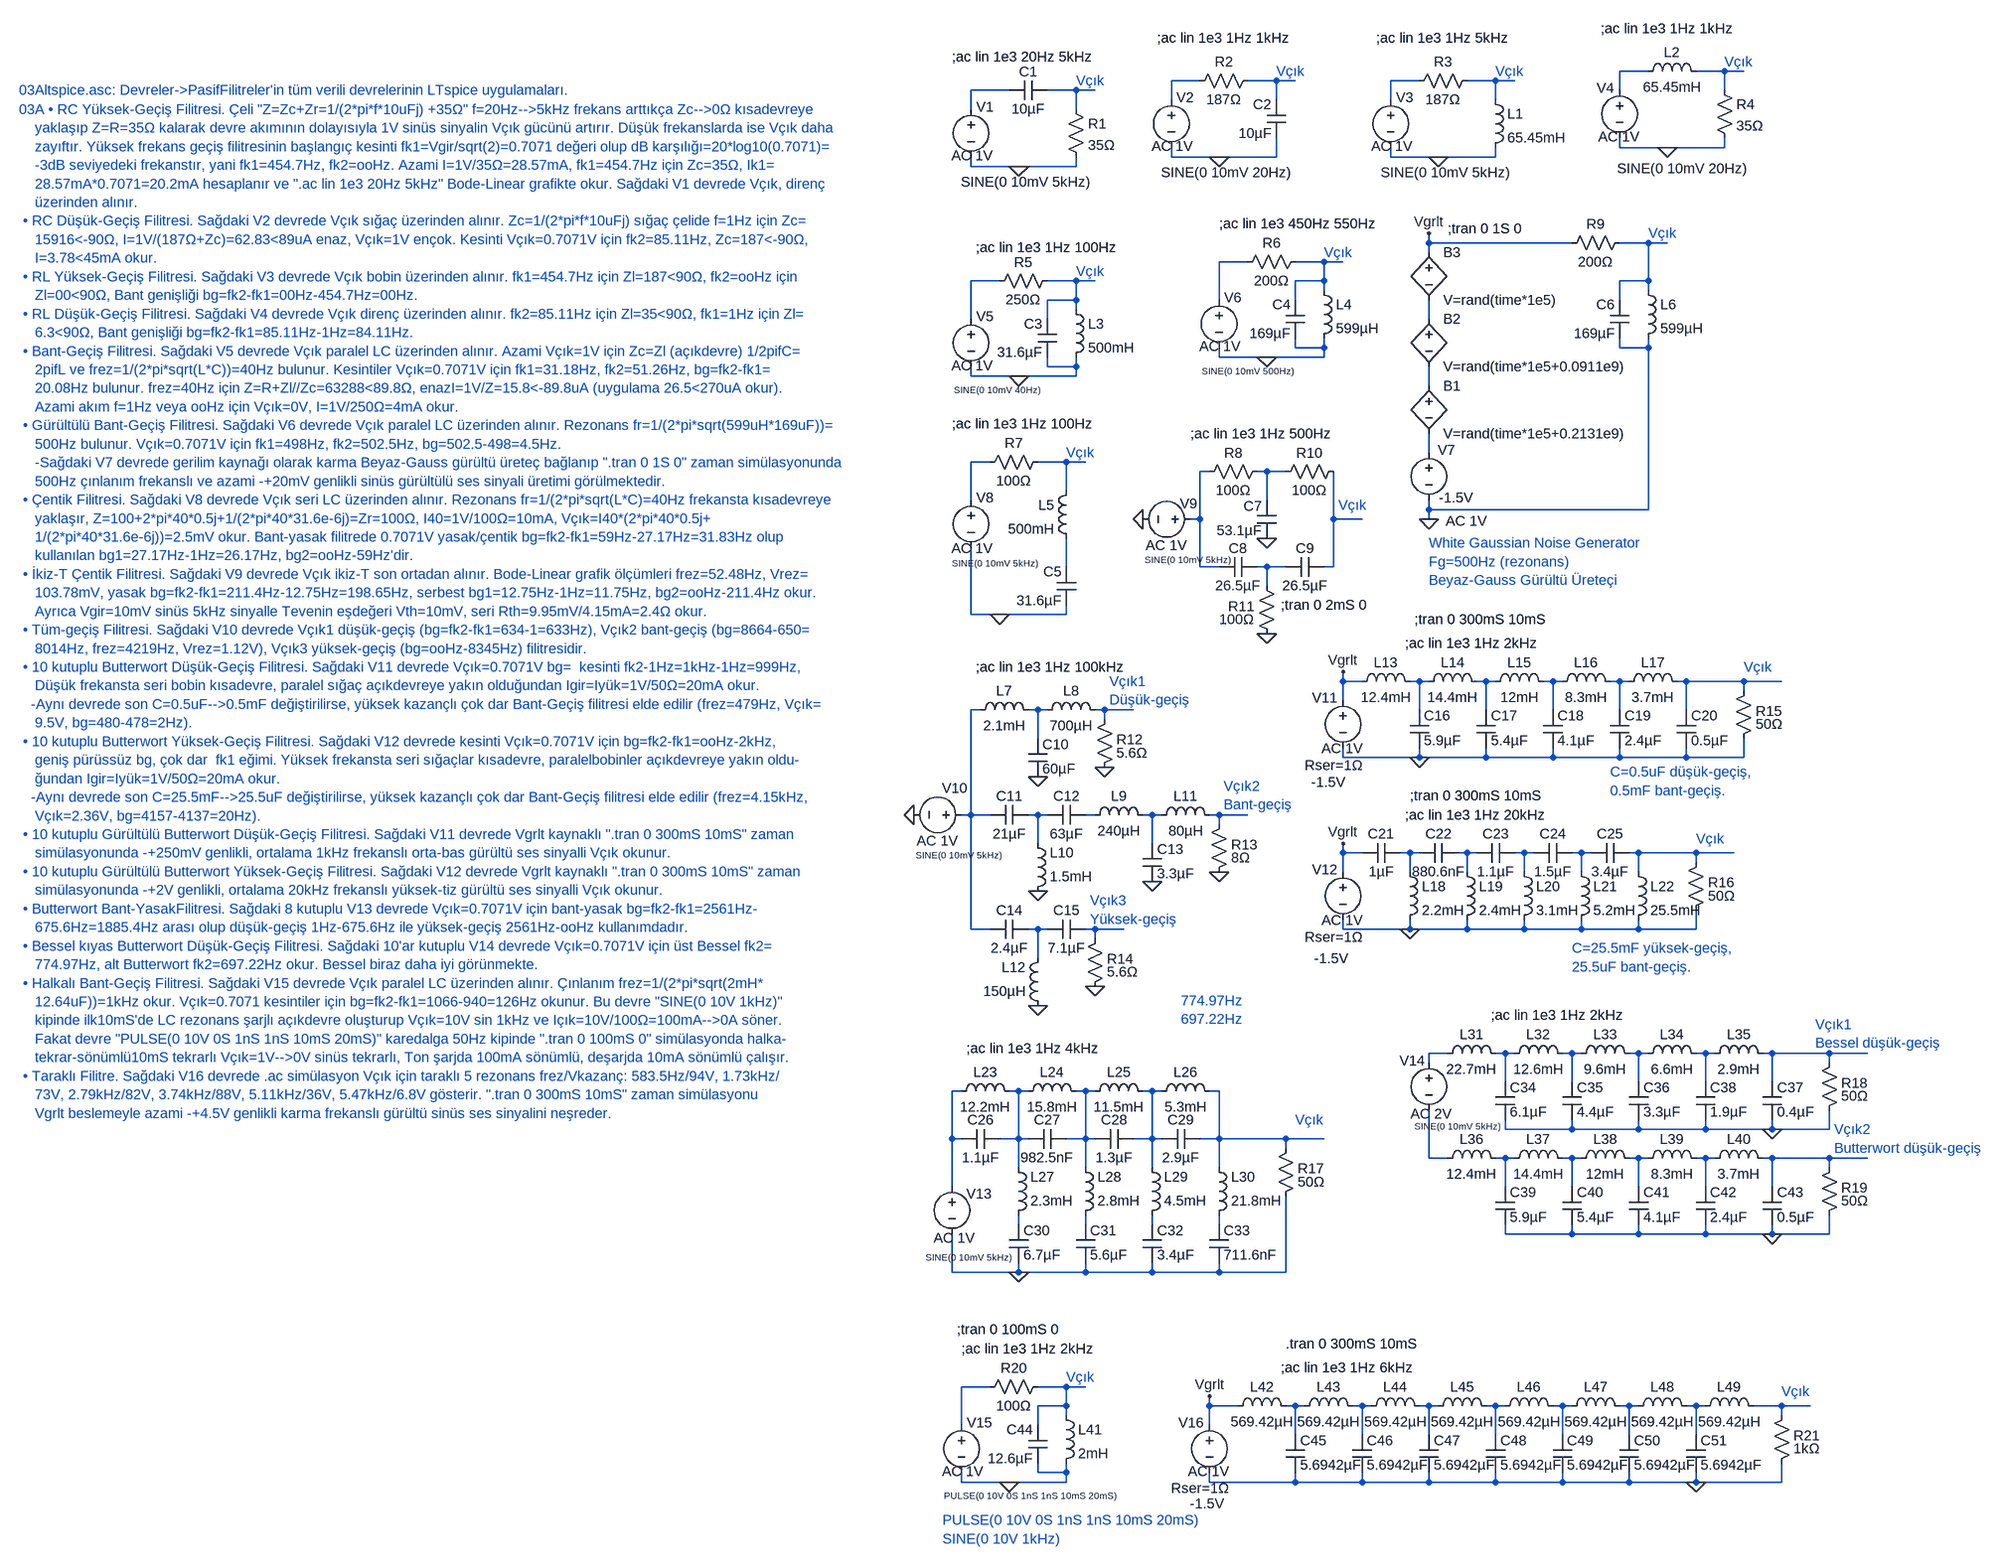
[diagram p0: schematic 03Altspice.asc]
03Altspice.asc, the LTspice schematic file:
Version 4
SHEET 1 3200 2492
WIRE 2224 16 2176 16
WIRE 2352 16 2304 16
WIRE 2384 16 2352 16
WIRE 1472 32 1424 32
WIRE 1600 32 1552 32
WIRE 1632 32 1600 32
WIRE 1840 32 1792 32
WIRE 1968 32 1920 32
WIRE 2000 32 1968 32
WIRE 1152 48 1088 48
WIRE 1264 48 1216 48
WIRE 1296 48 1264 48
WIRE 2176 48 2176 16
WIRE 2352 48 2352 16
WIRE 1424 64 1424 32
WIRE 1600 64 1600 32
WIRE 1792 64 1792 32
WIRE 1968 64 1968 32
WIRE 1088 80 1088 48
WIRE 1264 80 1264 48
WIRE 2176 144 2176 128
WIRE 2256 144 2176 144
WIRE 2352 144 2352 128
WIRE 2352 144 2256 144
WIRE 1424 160 1424 144
WIRE 1504 160 1424 160
WIRE 1600 160 1600 128
WIRE 1600 160 1504 160
WIRE 1792 160 1792 144
WIRE 1872 160 1792 160
WIRE 1968 160 1968 144
WIRE 1968 160 1872 160
WIRE 1088 176 1088 160
WIRE 1168 176 1088 176
WIRE 1264 176 1264 160
WIRE 1264 176 1168 176
WIRE 1856 304 1856 288
WIRE 2096 304 1856 304
WIRE 2224 304 2176 304
WIRE 2256 304 2224 304
WIRE 1856 320 1856 304
WIRE 1552 336 1504 336
WIRE 1680 336 1632 336
WIRE 1712 336 1680 336
WIRE 1136 368 1088 368
WIRE 1264 368 1216 368
WIRE 1296 368 1264 368
WIRE 1680 368 1680 336
WIRE 1680 368 1632 368
WIRE 2224 368 2224 304
WIRE 2224 368 2176 368
WIRE 1680 384 1680 368
WIRE 2224 384 2224 368
WIRE 1264 400 1264 368
WIRE 1264 400 1216 400
WIRE 1504 400 1504 336
WIRE 1632 400 1632 368
WIRE 2176 400 2176 368
WIRE 1264 416 1264 400
WIRE 1088 432 1088 368
WIRE 1216 432 1216 400
WIRE 1856 432 1856 400
WIRE 1632 480 1632 464
WIRE 1680 480 1680 464
WIRE 1680 480 1632 480
WIRE 2176 480 2176 464
WIRE 2224 480 2224 464
WIRE 2224 480 2176 480
WIRE 1504 496 1504 480
WIRE 1584 496 1504 496
WIRE 1680 496 1680 480
WIRE 1680 496 1584 496
WIRE 1216 512 1216 496
WIRE 1264 512 1264 496
WIRE 1264 512 1216 512
WIRE 1088 528 1088 512
WIRE 1168 528 1088 528
WIRE 1264 528 1264 512
WIRE 1264 528 1168 528
WIRE 1856 544 1856 512
WIRE 1856 656 1856 624
WIRE 1120 672 1088 672
WIRE 1248 672 1200 672
WIRE 1280 672 1248 672
WIRE 1488 688 1472 688
WIRE 1584 688 1568 688
WIRE 1616 688 1584 688
WIRE 1248 720 1248 672
WIRE 1088 736 1088 672
WIRE 1584 736 1584 688
WIRE 1856 752 1856 736
WIRE 2224 752 2224 480
WIRE 2224 752 1856 752
WIRE 1472 768 1472 688
WIRE 1472 768 1456 768
WIRE 1696 768 1696 688
WIRE 1744 768 1696 768
WIRE 1856 768 1856 752
WIRE 1248 848 1248 800
WIRE 1472 848 1472 768
WIRE 1504 848 1472 848
WIRE 1584 848 1568 848
WIRE 1616 848 1584 848
WIRE 1696 848 1696 768
WIRE 1696 848 1680 848
WIRE 1584 880 1584 848
WIRE 1088 928 1088 816
WIRE 1136 928 1088 928
WIRE 1248 928 1248 912
WIRE 1248 928 1136 928
WIRE 1712 1040 1712 1024
WIRE 1744 1040 1712 1040
WIRE 1840 1040 1824 1040
WIRE 1856 1040 1840 1040
WIRE 1952 1040 1936 1040
WIRE 1968 1040 1952 1040
WIRE 2064 1040 2048 1040
WIRE 2080 1040 2064 1040
WIRE 2176 1040 2160 1040
WIRE 2192 1040 2176 1040
WIRE 2288 1040 2272 1040
WIRE 2384 1040 2288 1040
WIRE 2448 1040 2384 1040
WIRE 2384 1056 2384 1040
WIRE 1712 1072 1712 1040
WIRE 1104 1088 1088 1088
WIRE 1200 1088 1184 1088
WIRE 1216 1088 1200 1088
WIRE 1312 1088 1296 1088
WIRE 1360 1088 1312 1088
WIRE 1840 1088 1840 1040
WIRE 1952 1088 1952 1040
WIRE 2064 1088 2064 1040
WIRE 2176 1088 2176 1040
WIRE 2288 1088 2288 1040
WIRE 1312 1104 1312 1088
WIRE 1200 1136 1200 1088
WIRE 1712 1168 1712 1152
WIRE 1840 1168 1840 1152
WIRE 1840 1168 1712 1168
WIRE 1952 1168 1952 1152
WIRE 1952 1168 1840 1168
WIRE 2064 1168 2064 1152
WIRE 2064 1168 1952 1168
WIRE 2176 1168 2176 1152
WIRE 2176 1168 2064 1168
WIRE 2288 1168 2288 1152
WIRE 2288 1168 2176 1168
WIRE 2384 1168 2384 1136
WIRE 2384 1168 2288 1168
WIRE 1088 1264 1088 1088
WIRE 1088 1264 1072 1264
WIRE 1120 1264 1088 1264
WIRE 1200 1264 1184 1264
WIRE 1216 1264 1200 1264
WIRE 1296 1264 1280 1264
WIRE 1392 1264 1376 1264
WIRE 1408 1264 1392 1264
WIRE 1504 1264 1488 1264
WIRE 1552 1264 1504 1264
WIRE 1504 1280 1504 1264
WIRE 1200 1312 1200 1264
WIRE 1392 1312 1392 1264
WIRE 1712 1328 1712 1312
WIRE 1744 1328 1712 1328
WIRE 1824 1328 1808 1328
WIRE 1840 1328 1824 1328
WIRE 1920 1328 1904 1328
WIRE 1936 1328 1920 1328
WIRE 2016 1328 2000 1328
WIRE 2032 1328 2016 1328
WIRE 2112 1328 2096 1328
WIRE 2128 1328 2112 1328
WIRE 2208 1328 2192 1328
WIRE 2304 1328 2208 1328
WIRE 2368 1328 2304 1328
WIRE 2304 1344 2304 1328
WIRE 1712 1360 1712 1328
WIRE 1824 1360 1824 1328
WIRE 1920 1360 1920 1328
WIRE 2016 1360 2016 1328
WIRE 2112 1360 2112 1328
WIRE 2208 1360 2208 1328
WIRE 1088 1456 1088 1264
WIRE 1120 1456 1088 1456
WIRE 1200 1456 1184 1456
WIRE 1216 1456 1200 1456
WIRE 1296 1456 1280 1456
WIRE 1344 1456 1296 1456
WIRE 1712 1456 1712 1440
WIRE 1824 1456 1824 1440
WIRE 1824 1456 1712 1456
WIRE 1920 1456 1920 1440
WIRE 1920 1456 1824 1456
WIRE 2016 1456 2016 1440
WIRE 2016 1456 1920 1456
WIRE 2112 1456 2112 1440
WIRE 2112 1456 2016 1456
WIRE 2208 1456 2208 1440
WIRE 2208 1456 2112 1456
WIRE 2304 1456 2304 1424
WIRE 2304 1456 2208 1456
WIRE 1296 1472 1296 1456
WIRE 1200 1504 1200 1456
WIRE 1888 1664 1856 1664
WIRE 1984 1664 1968 1664
WIRE 2000 1664 1984 1664
WIRE 2096 1664 2080 1664
WIRE 2112 1664 2096 1664
WIRE 2208 1664 2192 1664
WIRE 2224 1664 2208 1664
WIRE 2320 1664 2304 1664
WIRE 2336 1664 2320 1664
WIRE 2432 1664 2416 1664
WIRE 2528 1664 2432 1664
WIRE 2592 1664 2528 1664
WIRE 1856 1680 1856 1664
WIRE 2528 1680 2528 1664
WIRE 1984 1712 1984 1664
WIRE 2096 1712 2096 1664
WIRE 2208 1712 2208 1664
WIRE 2320 1712 2320 1664
WIRE 2432 1712 2432 1664
WIRE 1072 1728 1056 1728
WIRE 1168 1728 1152 1728
WIRE 1184 1728 1168 1728
WIRE 1280 1728 1264 1728
WIRE 1296 1728 1280 1728
WIRE 1392 1728 1376 1728
WIRE 1408 1728 1392 1728
WIRE 1504 1728 1488 1728
WIRE 1984 1792 1984 1776
WIRE 2096 1792 2096 1776
WIRE 2096 1792 1984 1792
WIRE 2208 1792 2208 1776
WIRE 2208 1792 2096 1792
WIRE 2320 1792 2320 1776
WIRE 2320 1792 2208 1792
WIRE 2432 1792 2432 1776
WIRE 2432 1792 2320 1792
WIRE 2528 1792 2528 1760
WIRE 2528 1792 2432 1792
WIRE 1056 1808 1056 1728
WIRE 1072 1808 1056 1808
WIRE 1168 1808 1168 1728
WIRE 1168 1808 1136 1808
WIRE 1184 1808 1168 1808
WIRE 1280 1808 1280 1728
WIRE 1280 1808 1248 1808
WIRE 1296 1808 1280 1808
WIRE 1392 1808 1392 1728
WIRE 1392 1808 1360 1808
WIRE 1408 1808 1392 1808
WIRE 1504 1808 1504 1728
WIRE 1504 1808 1472 1808
WIRE 1616 1808 1504 1808
WIRE 1680 1808 1616 1808
WIRE 1616 1824 1616 1808
WIRE 1856 1840 1856 1760
WIRE 1888 1840 1856 1840
WIRE 1984 1840 1968 1840
WIRE 2000 1840 1984 1840
WIRE 2096 1840 2080 1840
WIRE 2112 1840 2096 1840
WIRE 2208 1840 2192 1840
WIRE 2224 1840 2208 1840
WIRE 2320 1840 2304 1840
WIRE 2336 1840 2320 1840
WIRE 2432 1840 2416 1840
WIRE 2528 1840 2432 1840
WIRE 2592 1840 2528 1840
WIRE 1168 1856 1168 1808
WIRE 1280 1856 1280 1808
WIRE 1392 1856 1392 1808
WIRE 1504 1856 1504 1808
WIRE 2528 1856 2528 1840
WIRE 1056 1888 1056 1808
WIRE 1984 1888 1984 1840
WIRE 2096 1888 2096 1840
WIRE 2208 1888 2208 1840
WIRE 2320 1888 2320 1840
WIRE 2432 1888 2432 1840
WIRE 1168 1952 1168 1936
WIRE 1280 1952 1280 1936
WIRE 1392 1952 1392 1936
WIRE 1504 1952 1504 1936
WIRE 1984 1968 1984 1952
WIRE 2096 1968 2096 1952
WIRE 2096 1968 1984 1968
WIRE 2208 1968 2208 1952
WIRE 2208 1968 2096 1968
WIRE 2320 1968 2320 1952
WIRE 2320 1968 2208 1968
WIRE 2432 1968 2432 1952
WIRE 2432 1968 2320 1968
WIRE 2528 1968 2528 1936
WIRE 2528 1968 2432 1968
WIRE 1056 2032 1056 1968
WIRE 1168 2032 1168 2016
WIRE 1168 2032 1056 2032
WIRE 1280 2032 1280 2016
WIRE 1280 2032 1168 2032
WIRE 1392 2032 1392 2016
WIRE 1392 2032 1280 2032
WIRE 1504 2032 1504 2016
WIRE 1504 2032 1392 2032
WIRE 1616 2032 1616 1904
WIRE 1616 2032 1504 2032
WIRE 1120 2224 1072 2224
WIRE 1248 2224 1200 2224
WIRE 1280 2224 1248 2224
WIRE 1248 2256 1248 2224
WIRE 1248 2256 1200 2256
WIRE 1488 2256 1488 2240
WIRE 1536 2256 1488 2256
WIRE 1632 2256 1616 2256
WIRE 1648 2256 1632 2256
WIRE 1744 2256 1728 2256
WIRE 1760 2256 1744 2256
WIRE 1856 2256 1840 2256
WIRE 1872 2256 1856 2256
WIRE 1968 2256 1952 2256
WIRE 1984 2256 1968 2256
WIRE 2080 2256 2064 2256
WIRE 2096 2256 2080 2256
WIRE 2192 2256 2176 2256
WIRE 2208 2256 2192 2256
WIRE 2304 2256 2288 2256
WIRE 2320 2256 2304 2256
WIRE 2448 2256 2400 2256
WIRE 2496 2256 2448 2256
WIRE 1248 2272 1248 2256
WIRE 2448 2272 2448 2256
WIRE 1072 2288 1072 2224
WIRE 1200 2288 1200 2256
WIRE 1488 2288 1488 2256
WIRE 1632 2304 1632 2256
WIRE 1744 2304 1744 2256
WIRE 1856 2304 1856 2256
WIRE 1968 2304 1968 2256
WIRE 2080 2304 2080 2256
WIRE 2192 2304 2192 2256
WIRE 2304 2304 2304 2256
WIRE 1200 2368 1200 2352
WIRE 1248 2368 1248 2352
WIRE 1248 2368 1200 2368
WIRE 1072 2384 1072 2368
WIRE 1152 2384 1072 2384
WIRE 1248 2384 1248 2368
WIRE 1248 2384 1152 2384
WIRE 1488 2384 1488 2368
WIRE 1632 2384 1632 2368
WIRE 1632 2384 1488 2384
WIRE 1744 2384 1744 2368
WIRE 1744 2384 1632 2384
WIRE 1856 2384 1856 2368
WIRE 1856 2384 1744 2384
WIRE 1968 2384 1968 2368
WIRE 1968 2384 1856 2384
WIRE 2080 2384 2080 2368
WIRE 2080 2384 1968 2384
WIRE 2192 2384 2192 2368
WIRE 2192 2384 2080 2384
WIRE 2304 2384 2304 2368
WIRE 2304 2384 2192 2384
WIRE 2448 2384 2448 2352
WIRE 2448 2384 2304 2384
FLAG 1168 176 0
FLAG 1504 160 0
FLAG 1872 160 0
FLAG 2256 144 0
FLAG 1168 528 0
FLAG 1584 496 0
FLAG 1856 768 0
FLAG 1136 928 0
FLAG 1376 768 0
FLAG 1584 800 0
FLAG 1584 960 0
FLAG 1200 1200 0
FLAG 1200 1392 0
FLAG 1392 1376 0
FLAG 1504 1360 0
FLAG 1312 1184 0
FLAG 1200 1584 0
FLAG 1296 1552 0
FLAG 992 1264 0
FLAG 1840 1168 0
FLAG 1824 1456 0
FLAG 1856 288 Vgrlt
FLAG 1712 1024 Vgrlt
FLAG 1712 1312 Vgrlt
FLAG 1168 2032 0
FLAG 2432 1792 0
FLAG 2432 1968 0
FLAG 1152 2384 0
FLAG 2304 2384 0
FLAG 1488 2240 Vgrlt
SYMBOL voltage 1088 64 R0
WINDOW 0 9 12 Left 2
WINDOW 3 -17 138 Left 2
WINDOW 123 -33 94 Left 2
WINDOW 39 0 0 Left 0
SYMATTR InstName V1
SYMATTR Value SINE(0 10mV 5kHz)
SYMATTR Value2 AC 1V
SYMBOL cap 1216 32 R90
WINDOW 0 0 32 VBottom 2
WINDOW 3 32 32 VTop 2
SYMATTR InstName C1
SYMATTR Value 10µF
SYMBOL res 1248 64 R0
SYMATTR InstName R1
SYMATTR Value 35Ω
SYMBOL voltage 1424 48 R0
WINDOW 0 9 12 Left 2
WINDOW 3 -17 138 Left 2
WINDOW 123 -33 94 Left 2
WINDOW 39 0 0 Left 0
SYMATTR InstName V2
SYMATTR Value SINE(0 10mV 20Hz)
SYMATTR Value2 AC 1V
SYMBOL cap 1616 128 R180
WINDOW 0 24 56 Left 2
WINDOW 3 24 8 Left 2
SYMATTR InstName C2
SYMATTR Value 10µF
SYMBOL res 1568 16 R90
WINDOW 0 0 56 VBottom 2
WINDOW 3 32 56 VTop 2
SYMATTR InstName R2
SYMATTR Value 187Ω
SYMBOL voltage 1792 48 R0
WINDOW 0 9 12 Left 2
WINDOW 3 -17 138 Left 2
WINDOW 123 -33 94 Left 2
WINDOW 39 0 0 Left 0
SYMATTR InstName V3
SYMATTR Value SINE(0 10mV 5kHz)
SYMATTR Value2 AC 1V
SYMBOL res 1936 16 R90
WINDOW 0 0 56 VBottom 2
WINDOW 3 32 56 VTop 2
SYMATTR InstName R3
SYMATTR Value 187Ω
SYMBOL ind 1952 48 R0
SYMATTR InstName L1
SYMATTR Value 65.45mH
SYMBOL voltage 2176 32 M0
WINDOW 0 9 12 Left 2
WINDOW 3 -214 147 Left 2
WINDOW 123 -33 94 Left 2
WINDOW 39 0 0 Left 0
SYMATTR InstName V4
SYMATTR Value SINE(0 10mV 20Hz)
SYMATTR Value2 AC 1V
SYMBOL res 2336 32 R0
SYMATTR InstName R4
SYMATTR Value 35Ω
SYMBOL ind 2208 32 R270
WINDOW 0 32 56 VTop 2
WINDOW 3 5 56 VBottom 2
SYMATTR InstName L2
SYMATTR Value 65.45mH
SYMBOL voltage 1088 416 R0
WINDOW 0 9 12 Left 2
WINDOW 3 -29 135 Left 1
WINDOW 123 -33 94 Left 2
WINDOW 39 0 0 Left 0
SYMATTR InstName V5
SYMATTR Value SINE(0 10mV 40Hz)
SYMATTR Value2 AC 1V
SYMBOL res 1232 352 R90
WINDOW 0 0 56 VBottom 2
WINDOW 3 32 56 VTop 2
SYMATTR InstName R5
SYMATTR Value 250Ω
SYMBOL ind 1248 400 R0
SYMATTR InstName L3
SYMATTR Value 500mH
SYMBOL cap 1232 496 R180
WINDOW 0 24 56 Left 2
WINDOW 3 24 8 Left 2
SYMATTR InstName C3
SYMATTR Value 31.6µF
SYMBOL voltage 1504 384 R0
WINDOW 0 9 12 Left 2
WINDOW 3 -29 135 Left 1
WINDOW 123 -33 94 Left 2
WINDOW 39 0 0 Left 0
SYMATTR InstName V6
SYMATTR Value SINE(0 10mV 500Hz)
SYMATTR Value2 AC 1V
SYMBOL res 1648 320 R90
WINDOW 0 0 56 VBottom 2
WINDOW 3 32 56 VTop 2
SYMATTR InstName R6
SYMATTR Value 200Ω
SYMBOL ind 1664 368 R0
SYMATTR InstName L4
SYMATTR Value 599µH
SYMBOL cap 1648 464 R180
WINDOW 0 24 56 Left 2
WINDOW 3 24 8 Left 2
SYMATTR InstName C4
SYMATTR Value 169µF
SYMBOL BV 1856 528 R0
SYMATTR InstName B1
SYMATTR Value V=rand(time*1e5+0.2131e9)
SYMBOL bv 1856 416 R0
SYMATTR InstName B2
SYMATTR Value V=rand(time*1e5+0.0911e9)
SYMBOL bv 1856 304 R0
SYMATTR InstName B3
SYMATTR Value V=rand(time*1e5)
SYMBOL voltage 1856 640 R0
WINDOW 3 17 92 Left 2
WINDOW 123 28 131 Left 2
WINDOW 39 0 0 Left 0
WINDOW 0 15 12 Left 2
SYMATTR Value -1.5V
SYMATTR Value2 AC 1V
SYMATTR InstName V7
SYMBOL res 2192 288 R90
WINDOW 0 0 56 VBottom 2
WINDOW 3 32 56 VTop 2
SYMATTR InstName R9
SYMATTR Value 200Ω
SYMBOL ind 2208 368 R0
SYMATTR InstName L6
SYMATTR Value 599µH
SYMBOL cap 2192 464 R180
WINDOW 0 24 56 Left 2
WINDOW 3 24 8 Left 2
SYMATTR InstName C6
SYMATTR Value 169µF
SYMBOL voltage 1088 720 R0
WINDOW 0 9 12 Left 2
WINDOW 3 -32 122 Left 1
WINDOW 123 -33 97 Left 2
WINDOW 39 0 0 Left 0
SYMATTR InstName V8
SYMATTR Value SINE(0 10mV 5kHz)
SYMATTR Value2 AC 1V
SYMBOL res 1216 656 R90
WINDOW 0 0 56 VBottom 2
WINDOW 3 32 56 VTop 2
SYMATTR InstName R7
SYMATTR Value 100Ω
SYMBOL ind 1264 704 M0
SYMATTR InstName L5
SYMATTR Value 500mH
SYMBOL cap 1264 912 R180
WINDOW 0 24 56 Left 2
WINDOW 3 24 8 Left 2
SYMATTR InstName C5
SYMATTR Value 31.6µF
SYMBOL voltage 1472 768 R90
WINDOW 0 -26 4 VRight 2
WINDOW 3 68 -52 VRight 1
WINDOW 123 44 22 VRight 2
WINDOW 39 0 0 Left 0
SYMATTR InstName V9
SYMATTR Value SINE(0 10mV 5kHz)
SYMATTR Value2 AC 1V
SYMBOL cap 1600 800 R180
WINDOW 0 24 54 Left 2
WINDOW 3 24 13 Left 2
SYMATTR InstName C7
SYMATTR Value 53.1µF
SYMBOL res 1584 672 R90
WINDOW 0 0 56 VBottom 2
WINDOW 3 32 56 VTop 2
SYMATTR InstName R8
SYMATTR Value 100Ω
SYMBOL res 1712 672 R90
WINDOW 0 0 56 VBottom 2
WINDOW 3 32 56 VTop 2
SYMATTR InstName R10
SYMATTR Value 100Ω
SYMBOL cap 1504 864 R270
WINDOW 0 32 32 VTop 2
WINDOW 3 0 32 VBottom 2
SYMATTR InstName C8
SYMATTR Value 26.5µF
SYMBOL cap 1616 864 R270
WINDOW 0 32 32 VTop 2
WINDOW 3 0 32 VBottom 2
SYMATTR InstName C9
SYMATTR Value 26.5µF
SYMBOL res 1600 976 R180
WINDOW 0 36 62 Left 2
WINDOW 3 36 40 Left 2
SYMATTR InstName R11
SYMATTR Value 100Ω
SYMBOL ind 1088 1104 R270
WINDOW 0 32 56 VTop 2
WINDOW 3 5 56 VBottom 2
SYMATTR InstName L7
SYMATTR Value 2.1mH
SYMBOL cap 1184 1200 M180
WINDOW 0 24 54 Left 2
WINDOW 3 24 13 Left 2
SYMATTR InstName C10
SYMATTR Value 60µF
SYMBOL ind 1200 1104 R270
WINDOW 0 32 56 VTop 2
WINDOW 3 5 56 VBottom 2
SYMATTR InstName L8
SYMATTR Value 700µH
SYMBOL res 1296 1200 M180
WINDOW 0 36 62 Left 2
WINDOW 3 36 40 Left 2
SYMATTR InstName R12
SYMATTR Value 5.6Ω
SYMBOL ind 1184 1408 M180
WINDOW 0 36 80 Left 2
WINDOW 3 36 40 Left 2
SYMATTR InstName L10
SYMATTR Value 1.5mH
SYMBOL cap 1120 1280 R270
WINDOW 0 32 32 VTop 2
WINDOW 3 0 32 VBottom 2
SYMATTR InstName C11
SYMATTR Value 21µF
SYMBOL cap 1216 1280 R270
WINDOW 0 32 32 VTop 2
WINDOW 3 0 32 VBottom 2
SYMATTR InstName C12
SYMATTR Value 63µF
SYMBOL ind 1280 1280 R270
WINDOW 0 32 56 VTop 2
WINDOW 3 5 56 VBottom 2
SYMATTR InstName L9
SYMATTR Value 240µH
SYMBOL cap 1376 1376 M180
WINDOW 0 24 54 Left 2
WINDOW 3 24 13 Left 2
SYMATTR InstName C13
SYMATTR Value 3.3µF
SYMBOL ind 1392 1280 R270
WINDOW 0 32 56 VTop 2
WINDOW 3 5 56 VBottom 2
SYMATTR InstName L11
SYMATTR Value 80µH
SYMBOL res 1488 1376 M180
WINDOW 0 36 62 Left 2
WINDOW 3 36 40 Left 2
SYMATTR InstName R13
SYMATTR Value 8Ω
SYMBOL ind 1216 1600 R180
WINDOW 0 36 80 Left 2
WINDOW 3 36 40 Left 2
SYMATTR InstName L12
SYMATTR Value 150µH
SYMBOL cap 1120 1472 R270
WINDOW 0 32 32 VTop 2
WINDOW 3 0 32 VBottom 2
SYMATTR InstName C14
SYMATTR Value 2.4µF
SYMBOL cap 1216 1472 R270
WINDOW 0 32 32 VTop 2
WINDOW 3 0 32 VBottom 2
SYMATTR InstName C15
SYMATTR Value 7.1µF
SYMBOL res 1280 1568 M180
WINDOW 0 36 62 Left 2
WINDOW 3 36 40 Left 2
SYMATTR InstName R14
SYMATTR Value 5.6Ω
SYMBOL voltage 1088 1264 R90
WINDOW 0 -45 6 VRight 2
WINDOW 3 68 -52 VRight 1
WINDOW 123 44 22 VRight 2
WINDOW 39 0 0 Left 0
SYMATTR InstName V10
SYMATTR Value SINE(0 10mV 5kHz)
SYMATTR Value2 AC 1V
SYMBOL ind 1728 1056 R270
WINDOW 0 32 56 VTop 2
WINDOW 3 5 56 VBottom 2
SYMATTR InstName L13
SYMATTR Value 12.4mH
SYMBOL ind 1840 1056 R270
WINDOW 0 32 56 VTop 2
WINDOW 3 5 56 VBottom 2
SYMATTR InstName L14
SYMATTR Value 14.4mH
SYMBOL ind 1952 1056 R270
WINDOW 0 32 56 VTop 2
WINDOW 3 5 56 VBottom 2
SYMATTR InstName L15
SYMATTR Value 12mH
SYMBOL ind 2064 1056 R270
WINDOW 0 32 56 VTop 2
WINDOW 3 5 56 VBottom 2
SYMATTR InstName L16
SYMATTR Value 8.3mH
SYMBOL ind 2176 1056 R270
WINDOW 0 32 56 VTop 2
WINDOW 3 5 56 VBottom 2
SYMATTR InstName L17
SYMATTR Value 3.7mH
SYMBOL cap 1824 1152 M180
WINDOW 0 24 54 Left 2
WINDOW 3 24 13 Left 2
SYMATTR InstName C16
SYMATTR Value 5.9µF
SYMBOL cap 1936 1152 M180
WINDOW 0 24 54 Left 2
WINDOW 3 24 13 Left 2
SYMATTR InstName C17
SYMATTR Value 5.4µF
SYMBOL cap 2048 1152 M180
WINDOW 0 24 54 Left 2
WINDOW 3 24 13 Left 2
SYMATTR InstName C18
SYMATTR Value 4.1µF
SYMBOL cap 2160 1152 M180
WINDOW 0 24 54 Left 2
WINDOW 3 24 13 Left 2
SYMATTR InstName C19
SYMATTR Value 2.4µF
SYMBOL cap 2272 1152 M180
WINDOW 0 24 54 Left 2
WINDOW 3 24 13 Left 2
SYMATTR InstName C20
SYMATTR Value 0.5µF
SYMBOL res 2368 1152 M180
WINDOW 0 36 62 Left 2
WINDOW 3 36 40 Left 2
SYMATTR InstName R15
SYMATTR Value 50Ω
SYMBOL voltage 1712 1056 M0
WINDOW 0 9 12 Left 2
WINDOW 3 -4 153 Left 2
WINDOW 123 -33 97 Left 2
WINDOW 39 -33 125 Left 2
SYMATTR InstName V11
SYMATTR Value -1.5V
SYMATTR Value2 AC 1V
SYMATTR SpiceLine Rser=1Ω
SYMBOL ind 1808 1344 R0
SYMATTR InstName L18
SYMATTR Value 2.2mH
SYMBOL ind 1904 1344 R0
SYMATTR InstName L19
SYMATTR Value 2.4mH
SYMBOL ind 2000 1344 R0
SYMATTR InstName L20
SYMATTR Value 3.1mH
SYMBOL ind 2096 1344 R0
SYMATTR InstName L21
SYMATTR Value 5.2mH
SYMBOL ind 2192 1344 R0
SYMATTR InstName L22
SYMATTR Value 25.5mH
SYMBOL cap 1744 1312 M90
WINDOW 0 0 32 VBottom 2
WINDOW 3 32 32 VTop 2
SYMATTR InstName C21
SYMATTR Value 1µF
SYMBOL cap 1840 1312 M90
WINDOW 0 0 32 VBottom 2
WINDOW 3 32 32 VTop 2
SYMATTR InstName C22
SYMATTR Value 880.6nF
SYMBOL cap 1936 1312 M90
WINDOW 0 0 32 VBottom 2
WINDOW 3 32 32 VTop 2
SYMATTR InstName C23
SYMATTR Value 1.1µF
SYMBOL cap 2032 1312 M90
WINDOW 0 0 32 VBottom 2
WINDOW 3 32 32 VTop 2
SYMATTR InstName C24
SYMATTR Value 1.5µF
SYMBOL cap 2128 1312 M90
WINDOW 0 0 32 VBottom 2
WINDOW 3 32 32 VTop 2
SYMATTR InstName C25
SYMATTR Value 3.4µF
SYMBOL res 2288 1440 M180
WINDOW 0 36 62 Left 2
WINDOW 3 36 40 Left 2
SYMATTR InstName R16
SYMATTR Value 50Ω
SYMBOL voltage 1712 1344 M0
WINDOW 0 9 12 Left 2
WINDOW 3 -9 161 Left 2
WINDOW 123 -33 97 Left 2
WINDOW 39 -33 125 Left 2
SYMATTR InstName V12
SYMATTR Value -1.5V
SYMATTR Value2 AC 1V
SYMATTR SpiceLine Rser=1Ω
SYMBOL ind 1056 1744 R270
WINDOW 0 32 56 VTop 2
WINDOW 3 5 56 VBottom 2
SYMATTR InstName L23
SYMATTR Value 12.2mH
SYMBOL cap 1072 1792 M90
WINDOW 0 0 32 VBottom 2
WINDOW 3 32 32 VTop 2
SYMATTR InstName C26
SYMATTR Value 1.1µF
SYMBOL ind 1168 1744 R270
WINDOW 0 32 56 VTop 2
WINDOW 3 5 56 VBottom 2
SYMATTR InstName L24
SYMATTR Value 15.8mH
SYMBOL cap 1184 1792 M90
WINDOW 0 0 32 VBottom 2
WINDOW 3 32 32 VTop 2
SYMATTR InstName C27
SYMATTR Value 982.5nF
SYMBOL ind 1280 1744 R270
WINDOW 0 32 56 VTop 2
WINDOW 3 5 56 VBottom 2
SYMATTR InstName L25
SYMATTR Value 11.5mH
SYMBOL cap 1296 1792 M90
WINDOW 0 0 32 VBottom 2
WINDOW 3 32 32 VTop 2
SYMATTR InstName C28
SYMATTR Value 1.3µF
SYMBOL ind 1392 1744 R270
WINDOW 0 32 56 VTop 2
WINDOW 3 5 56 VBottom 2
SYMATTR InstName L26
SYMATTR Value 5.3mH
SYMBOL cap 1408 1792 M90
WINDOW 0 0 32 VBottom 2
WINDOW 3 32 32 VTop 2
SYMATTR InstName C29
SYMATTR Value 2.9µF
SYMBOL ind 1152 1952 M180
WINDOW 0 36 80 Left 2
WINDOW 3 36 40 Left 2
SYMATTR InstName L27
SYMATTR Value 2.3mH
SYMBOL ind 1264 1952 M180
WINDOW 0 36 80 Left 2
WINDOW 3 36 40 Left 2
SYMATTR InstName L28
SYMATTR Value 2.8mH
SYMBOL ind 1376 1952 M180
WINDOW 0 36 80 Left 2
WINDOW 3 36 40 Left 2
SYMATTR InstName L29
SYMATTR Value 4.5mH
SYMBOL ind 1488 1952 M180
WINDOW 0 36 80 Left 2
WINDOW 3 36 40 Left 2
SYMATTR InstName L30
SYMATTR Value 21.8mH
SYMBOL cap 1152 2016 M180
WINDOW 0 24 54 Left 2
WINDOW 3 24 13 Left 2
SYMATTR InstName C30
SYMATTR Value 6.7µF
SYMBOL cap 1264 2016 M180
WINDOW 0 24 54 Left 2
WINDOW 3 24 13 Left 2
SYMATTR InstName C31
SYMATTR Value 5.6µF
SYMBOL cap 1376 2016 M180
WINDOW 0 24 54 Left 2
WINDOW 3 24 13 Left 2
SYMATTR InstName C32
SYMATTR Value 3.4µF
SYMBOL cap 1488 2016 M180
WINDOW 0 24 54 Left 2
WINDOW 3 24 13 Left 2
SYMATTR InstName C33
SYMATTR Value 711.6nF
SYMBOL res 1600 1920 M180
WINDOW 0 36 62 Left 2
WINDOW 3 36 40 Left 2
SYMATTR InstName R17
SYMATTR Value 50Ω
SYMBOL voltage 1056 1872 M0
WINDOW 0 -67 28 Left 2
WINDOW 3 -100 135 Left 1
WINDOW 123 -38 102 Left 2
WINDOW 39 0 0 Left 0
SYMATTR InstName V13
SYMATTR Value SINE(0 10mV 5kHz)
SYMATTR Value2 AC 1V
SYMBOL ind 1872 1680 R270
WINDOW 0 32 56 VTop 2
WINDOW 3 5 56 VBottom 2
SYMATTR InstName L31
SYMATTR Value 22.7mH
SYMBOL ind 1984 1680 R270
WINDOW 0 32 56 VTop 2
WINDOW 3 5 56 VBottom 2
SYMATTR InstName L32
SYMATTR Value 12.6mH
SYMBOL ind 2096 1680 R270
WINDOW 0 32 56 VTop 2
WINDOW 3 5 56 VBottom 2
SYMATTR InstName L33
SYMATTR Value 9.6mH
SYMBOL ind 2208 1680 R270
WINDOW 0 32 56 VTop 2
WINDOW 3 5 56 VBottom 2
SYMATTR InstName L34
SYMATTR Value 6.6mH
SYMBOL ind 2320 1680 R270
WINDOW 0 32 56 VTop 2
WINDOW 3 5 56 VBottom 2
SYMATTR InstName L35
SYMATTR Value 2.9mH
SYMBOL cap 1968 1776 M180
WINDOW 0 24 54 Left 2
WINDOW 3 24 13 Left 2
SYMATTR InstName C34
SYMATTR Value 6.1µF
SYMBOL cap 2080 1776 M180
WINDOW 0 24 54 Left 2
WINDOW 3 24 13 Left 2
SYMATTR InstName C35
SYMATTR Value 4.4µF
SYMBOL cap 2192 1776 M180
WINDOW 0 24 54 Left 2
WINDOW 3 24 13 Left 2
SYMATTR InstName C36
SYMATTR Value 3.3µF
SYMBOL cap 2416 1776 M180
WINDOW 0 24 54 Left 2
WINDOW 3 24 13 Left 2
SYMATTR InstName C37
SYMATTR Value 0.4µF
SYMBOL cap 2304 1776 M180
WINDOW 0 24 54 Left 2
WINDOW 3 24 13 Left 2
SYMATTR InstName C38
SYMATTR Value 1.9µF
SYMBOL res 2512 1776 M180
WINDOW 0 36 62 Left 2
WINDOW 3 36 40 Left 2
SYMATTR InstName R18
SYMATTR Value 50Ω
SYMBOL voltage 1856 1664 M0
WINDOW 0 6 13 Left 2
WINDOW 3 -120 123 Left 1
WINDOW 123 -38 102 Left 2
WINDOW 39 0 0 Left 0
SYMATTR InstName V14
SYMATTR Value SINE(0 10mV 5kHz)
SYMATTR Value2 AC 2V
SYMBOL ind 1872 1856 R270
WINDOW 0 32 56 VTop 2
WINDOW 3 5 56 VBottom 2
SYMATTR InstName L36
SYMATTR Value 12.4mH
SYMBOL ind 1984 1856 R270
WINDOW 0 32 56 VTop 2
WINDOW 3 5 56 VBottom 2
SYMATTR InstName L37
SYMATTR Value 14.4mH
SYMBOL ind 2096 1856 R270
WINDOW 0 32 56 VTop 2
WINDOW 3 5 56 VBottom 2
SYMATTR InstName L38
SYMATTR Value 12mH
SYMBOL ind 2208 1856 R270
WINDOW 0 32 56 VTop 2
WINDOW 3 5 56 VBottom 2
SYMATTR InstName L39
SYMATTR Value 8.3mH
SYMBOL ind 2320 1856 R270
WINDOW 0 32 56 VTop 2
WINDOW 3 5 56 VBottom 2
SYMATTR InstName L40
SYMATTR Value 3.7mH
SYMBOL cap 1968 1952 M180
WINDOW 0 24 54 Left 2
WINDOW 3 24 13 Left 2
SYMATTR InstName C39
SYMATTR Value 5.9µF
SYMBOL cap 2080 1952 M180
WINDOW 0 24 54 Left 2
WINDOW 3 24 13 Left 2
SYMATTR InstName C40
SYMATTR Value 5.4µF
SYMBOL cap 2192 1952 M180
WINDOW 0 24 54 Left 2
WINDOW 3 24 13 Left 2
SYMATTR InstName C41
SYMATTR Value 4.1µF
SYMBOL cap 2304 1952 M180
WINDOW 0 24 54 Left 2
WINDOW 3 24 13 Left 2
SYMATTR InstName C42
SYMATTR Value 2.4µF
SYMBOL cap 2416 1952 M180
WINDOW 0 24 54 Left 2
WINDOW 3 24 13 Left 2
SYMATTR InstName C43
SYMATTR Value 0.5µF
SYMBOL res 2512 1952 M180
WINDOW 0 36 62 Left 2
WINDOW 3 36 40 Left 2
SYMATTR InstName R19
SYMATTR Value 50Ω
SYMBOL voltage 1072 2272 R0
WINDOW 0 9 12 Left 2
WINDOW 3 -29 135 Left 1
WINDOW 123 -33 94 Left 2
WINDOW 39 0 0 Left 0
SYMATTR InstName V15
SYMATTR Value PULSE(0 10V 0S 1nS 1nS 10mS 20mS)
SYMATTR Value2 AC 1V
SYMBOL res 1216 2208 R90
WINDOW 0 0 56 VBottom 2
WINDOW 3 32 56 VTop 2
SYMATTR InstName R20
SYMATTR Value 100Ω
SYMBOL ind 1232 2256 R0
SYMATTR InstName L41
SYMATTR Value 2mH
SYMBOL cap 1216 2352 R180
WINDOW 0 24 56 Left 2
WINDOW 3 24 8 Left 2
SYMATTR InstName C44
SYMATTR Value 12.6µF
SYMBOL ind 1520 2272 R270
WINDOW 0 32 56 VTop 2
WINDOW 3 5 56 VBottom 2
SYMATTR InstName L42
SYMATTR Value 569.42µH
SYMBOL ind 1632 2272 R270
WINDOW 0 32 56 VTop 2
WINDOW 3 5 56 VBottom 2
SYMATTR InstName L43
SYMATTR Value 569.42µH
SYMBOL ind 1744 2272 R270
WINDOW 0 32 56 VTop 2
WINDOW 3 5 56 VBottom 2
SYMATTR InstName L44
SYMATTR Value 569.42µH
SYMBOL ind 1856 2272 R270
WINDOW 0 32 56 VTop 2
WINDOW 3 5 56 VBottom 2
SYMATTR InstName L45
SYMATTR Value 569.42µH
SYMBOL ind 1968 2272 R270
WINDOW 0 32 56 VTop 2
WINDOW 3 5 56 VBottom 2
SYMATTR InstName L46
SYMATTR Value 569.42µH
SYMBOL ind 2080 2272 R270
WINDOW 0 32 56 VTop 2
WINDOW 3 5 56 VBottom 2
SYMATTR InstName L47
SYMATTR Value 569.42µH
SYMBOL ind 2192 2272 R270
WINDOW 0 32 56 VTop 2
WINDOW 3 5 56 VBottom 2
SYMATTR InstName L48
SYMATTR Value 569.42µH
SYMBOL ind 2304 2272 R270
WINDOW 0 32 56 VTop 2
WINDOW 3 5 56 VBottom 2
SYMATTR InstName L49
SYMATTR Value 569.42µH
SYMBOL cap 1616 2368 M180
WINDOW 0 24 54 Left 2
WINDOW 3 24 13 Left 2
SYMATTR InstName C45
SYMATTR Value 5.6942µF
SYMBOL cap 1728 2368 M180
WINDOW 0 24 54 Left 2
WINDOW 3 24 13 Left 2
SYMATTR InstName C46
SYMATTR Value 5.6942µF
SYMBOL cap 1840 2368 M180
WINDOW 0 24 54 Left 2
WINDOW 3 24 13 Left 2
SYMATTR InstName C47
SYMATTR Value 5.6942µF
SYMBOL cap 1952 2368 M180
WINDOW 0 24 54 Left 2
WINDOW 3 24 13 Left 2
SYMATTR InstName C48
SYMATTR Value 5.6942µF
SYMBOL cap 2064 2368 M180
WINDOW 0 24 54 Left 2
WINDOW 3 24 13 Left 2
SYMATTR InstName C49
SYMATTR Value 5.6942µF
SYMBOL cap 2176 2368 M180
WINDOW 0 24 54 Left 2
WINDOW 3 24 13 Left 2
SYMATTR InstName C50
SYMATTR Value 5.6942µF
SYMBOL cap 2288 2368 M180
WINDOW 0 24 54 Left 2
WINDOW 3 24 13 Left 2
SYMATTR InstName C51
SYMATTR Value 5.6942µF
SYMBOL res 2432 2368 M180
WINDOW 0 36 62 Left 2
WINDOW 3 36 40 Left 2
SYMATTR InstName R21
SYMATTR Value 1kΩ
SYMBOL voltage 1488 2272 M0
WINDOW 0 9 12 Left 2
WINDOW 3 -25 148 Left 2
WINDOW 123 -33 94 Left 2
WINDOW 39 -33 122 Left 2
SYMATTR InstName V16
SYMATTR Value -1.5V
SYMATTR Value2 AC 1V
SYMATTR SpiceLine Rser=1Ω
TEXT -784 48 Left 2 ;03Altspice.asc: Devreler->PasifFilitreler'in tüm verili devrelerinin LTspice uygulamaları.
TEXT -784 80 Left 2 ;03A • RC Yüksek-Geçiş Filitresi. Çeli "Z=Zc+Zr=1/(2*pi*f*10uFj) +35Ω" f=20Hz-->5kHz frekans arttıkça Zc-->0Ω kısadevreye\n    yaklaşıp Z=R=35Ω kalarak devre akımının dolayısıyla 1V sinüs sinyalin Vçık gücünü artırır. Düşük frekanslarda ise Vçık daha\n    zayıftır. Yüksek frekans geçiş filitresinin başlangıç kesinti fk1=Vgir/sqrt(2)=0.7071 değeri olup dB karşılığı=20*log10(0.7071)=\n    -3dB seviyedeki frekanstır, yani fk1=454.7Hz, fk2=ooHz. Azami I=1V/35Ω=28.57mA, fk1=454.7Hz için Zc=35Ω, Ik1=\n    28.57mA*0.7071=20.2mA hesaplanır ve ".ac lin 1e3 20Hz 5kHz" Bode-Linear grafikte okur. Sağdaki V1 devrede Vçık, direnç\n    üzerinden alınır.\n • RC Düşük-Geçiş Filitresi. Sağdaki V2 devrede Vçık sığaç üzerinden alınır. Zc=1/(2*pi*f*10uFj) sığaç çelide f=1Hz için Zc=\n    15916<-90Ω, I=1V/(187Ω+Zc)=62.83<89uA enaz, Vçık=1V ençok. Kesinti Vçık=0.7071V için fk2=85.11Hz, Zc=187<-90Ω,\n    I=3.78<45mA okur.\n • RL Yüksek-Geçiş Filitresi. Sağdaki V3 devrede Vçık bobin üzerinden alınır. fk1=454.7Hz için Zl=187<90Ω, fk2=ooHz için \n    Zl=00<90Ω, Bant genişliği bg=fk2-fk1=00Hz-454.7Hz=00Hz.\n • RL Düşük-Geçiş Filitresi. Sağdaki V4 devrede Vçık direnç üzerinden alınır. fk2=85.11Hz için Zl=35<90Ω, fk1=1Hz için Zl=\n    6.3<90Ω, Bant genişliği bg=fk2-fk1=85.11Hz-1Hz=84.11Hz.\n • Bant-Geçiş Filitresi. Sağdaki V5 devrede Vçık paralel LC üzerinden alınır. Azami Vçık=1V için Zc=Zl (açıkdevre) 1/2pifC=\n    2pifL ve frez=1/(2*pi*sqrt(L*C))=40Hz bulunur. Kesintiler Vçık=0.7071V için fk1=31.18Hz, fk2=51.26Hz, bg=fk2-fk1=\n    20.08Hz bulunur. frez=40Hz için Z=R+Zl//Zc=63288<89.8Ω, enazI=1V/Z=15.8<-89.8uA (uygulama 26.5<270uA okur).\n    Azami akım f=1Hz veya ooHz için Vçık=0V, I=1V/250Ω=4mA okur.\n • Gürültülü Bant-Geçiş Filitresi. Sağdaki V6 devrede Vçık paralel LC üzerinden alınır. Rezonans fr=1/(2*pi*sqrt(599uH*169uF))=\n    500Hz bulunur. Vçık=0.7071V için fk1=498Hz, fk2=502.5Hz, bg=502.5-498=4.5Hz.\n    -Sağdaki V7 devrede gerilim kaynağı olarak karma Beyaz-Gauss gürültü üreteç bağlanıp ".tran 0 1S 0" zaman simülasyonunda \n    500Hz çınlanım frekanslı ve azami -+20mV genlikli sinüs gürültülü ses sinyali üretimi görülmektedir.\n • Çentik Filitresi. Sağdaki V8 devrede Vçık seri LC üzerinden alınır. Rezonans fr=1/(2*pi*sqrt(L*C)=40Hz frekansta kısadevreye\n    yaklaşır, Z=100+2*pi*40*0.5j+1/(2*pi*40*31.6e-6j)=Zr=100Ω, I40=1V/100Ω=10mA, Vçık=I40*(2*pi*40*0.5j+\n    1/(2*pi*40*31.6e-6j))=2.5mV okur. Bant-yasak filitrede 0.7071V yasak/çentik bg=fk2-fk1=59Hz-27.17Hz=31.83Hz olup\n    kullanılan bg1=27.17Hz-1Hz=26.17Hz, bg2=ooHz-59Hz'dir.\n • İkiz-T Çentik Filitresi. Sağdaki V9 devrede Vçık ikiz-T son ortadan alınır. Bode-Linear grafik ölçümleri frez=52.48Hz, Vrez=\n    103.78mV, yasak bg=fk2-fk1=211.4Hz-12.75Hz=198.65Hz, serbest bg1=12.75Hz-1Hz=11.75Hz, bg2=ooHz-211.4Hz okur.\n    Ayrıca Vgir=10mV sinüs 5kHz sinyalle Tevenin eşdeğeri Vth=10mV, seri Rth=9.95mV/4.15mA=2.4Ω okur.\n • Tüm-geçiş Filitresi. Sağdaki V10 devrede Vçık1 düşük-geçiş (bg=fk2-fk1=634-1=633Hz), Vçık2 bant-geçiş (bg=8664-650=\n    8014Hz, frez=4219Hz, Vrez=1.12V), Vçık3 yüksek-geçiş (bg=ooHz-8345Hz) filitresidir.\n • 10 kutuplu Butterwort Düşük-Geçiş Filitresi. Sağdaki V11 devrede Vçık=0.7071V bg=  kesinti fk2-1Hz=1kHz-1Hz=999Hz,\n    Düşük frekansta seri bobin kısadevre, paralel sığaç açıkdevreye yakın olduğundan Igir=Iyük=1V/50Ω=20mA okur.\n   -Aynı devrede son C=0.5uF-->0.5mF değiştirilirse, yüksek kazançlı çok dar Bant-Geçiş filitresi elde edilir (frez=479Hz, Vçık=\n    9.5V, bg=480-478=2Hz).\n • 10 kutuplu Butterwort Yüksek-Geçiş Filitresi. Sağdaki V12 devrede kesinti Vçık=0.7071V için bg=fk2-fk1=ooHz-2kHz,\n    geniş pürüssüz bg, çok dar  fk1 eğimi. Yüksek frekansta seri sığaçlar kısadevre, paralelbobinler açıkdevreye yakın oldu-\n    ğundan Igir=Iyük=1V/50Ω=20mA okur.\n   -Aynı devrede son C=25.5mF-->25.5uF değiştirilirse, yüksek kazançlı çok dar Bant-Geçiş filitresi elde edilir (frez=4.15kHz, \n    Vçık=2.36V, bg=4157-4137=20Hz).\n • 10 kutuplu Gürültülü Butterwort Düşük-Geçiş Filitresi. Sağdaki V11 devrede Vgrlt kaynaklı ".tran 0 300mS 10mS" zaman\n    simülasyonunda -+250mV genlikli, ortalama 1kHz frekanslı orta-bas gürültü ses sinyalli Vçık okunur.\n • 10 kutuplu Gürültülü Butterwort Yüksek-Geçiş Filitresi. Sağdaki V12 devrede Vgrlt kaynaklı ".tran 0 300mS 10mS" zaman\n    simülasyonunda -+2V genlikli, ortalama 20kHz frekanslı yüksek-tiz gürültü ses sinyalli Vçık okunur.\n • Butterwort Bant-YasakFilitresi. Sağdaki 8 kutuplu V13 devrede Vçık=0.7071V için bant-yasak bg=fk2-fk1=2561Hz-\n    675.6Hz=1885.4Hz arası olup düşük-geçiş 1Hz-675.6Hz ile yüksek-geçiş 2561Hz-ooHz kullanımdadır.\n • Bessel kıyas Butterwort Düşük-Geçiş Filitresi. Sağdaki 10'ar kutuplu V14 devrede Vçık=0.7071V için üst Bessel fk2=\n    774.97Hz, alt Butterwort fk2=697.22Hz okur. Bessel biraz daha iyi görünmekte.\n • Halkalı Bant-Geçiş Filitresi. Sağdaki V15 devrede Vçık paralel LC üzerinden alınır. Çınlanım frez=1/(2*pi*sqrt(2mH*\n    12.64uF))=1kHz okur. Vçık=0.7071 kesintiler için bg=fk2-fk1=1066-940=126Hz okunur. Bu devre "SINE(0 10V 1kHz)" \n    kipinde ilk10mS'de LC rezonans şarjlı açıkdevre oluşturup Vçık=10V sin 1kHz ve Içık=10V/100Ω=100mA-->0A söner. \n    Fakat devre "PULSE(0 10V 0S 1nS 1nS 10mS 20mS)" karedalga 50Hz kipinde ".tran 0 100mS 0" simülasyonda halka-\n    tekrar-sönümlü10mS tekrarlı Vçık=1V-->0V sinüs tekrarlı, Ton şarjda 100mA sönümlü, deşarjda 10mA sönümlü çalışır.\n • Taraklı Filitre. Sağdaki V16 devrede .ac simülasyon Vçık için taraklı 5 rezonans frez/Vkazanç: 583.5Hz/94V, 1.73kHz/\n    73V, 2.79kHz/82V, 3.74kHz/88V, 5.11kHz/36V, 5.47kHz/6.8V gösterir. ".tran 0 300mS 10mS" zaman simülasyonu\n    Vgrlt beslemeyle azami -+4.5V genlikli karma frekanslı gürültü sinüs ses sinyalini neşreder.
TEXT 1056 -8 Left 2 !;ac lin 1e3 20Hz 5kHz
TEXT 1264 32 Left 2 ;Vçık
TEXT 1600 16 Left 2 ;Vçık
TEXT 1400 -40 Left 2 !;ac lin 1e3 1Hz 1kHz
TEXT 1968 16 Left 2 ;Vçık
TEXT 1768 -40 Left 2 !;ac lin 1e3 1Hz 5kHz
TEXT 2352 0 Left 2 ;Vçık
TEXT 2144 -56 Left 2 !;ac lin 1e3 1Hz 1kHz
TEXT 1264 352 Left 2 ;Vçık
TEXT 1096 312 Left 2 !;ac lin 1e3 1Hz 100Hz
TEXT 1680 320 Left 2 ;Vçık
TEXT 1504 272 Left 2 !;ac lin 1e3 450Hz 550Hz
TEXT 1888 280 Left 2 !;tran 0 1S 0
TEXT 1856 808 Left 2 ;White Gaussian Noise Generator\nFg=500Hz (rezonans)\nBeyaz-Gauss Gürültü Üreteçi
TEXT 2224 288 Left 2 ;Vçık
TEXT 1248 656 Left 2 ;Vçık
TEXT 1056 608 Left 2 !;ac lin 1e3 1Hz 100Hz
TEXT 1704 744 Left 2 ;Vçık
TEXT 1456 624 Left 2 !;ac lin 1e3 1Hz 500Hz
TEXT 1608 912 Left 2 !;tran 0 2mS 0
TEXT 1096 1016 Left 2 !;ac lin 1e3 1Hz 100kHz
TEXT 1320 1040 Left 2 ;Vçık1\nDüşük-geçiş
TEXT 1512 1216 Left 2 ;Vçık2\nBant-geçiş
TEXT 1288 1408 Left 2 ;Vçık3\nYüksek-geçiş
TEXT 2384 1016 Left 2 ;Vçık
TEXT 1816 976 Left 2 !;ac lin 1e3 1Hz 2kHz
TEXT 2304 1304 Left 2 ;Vçık
TEXT 1816 1264 Left 2 !;ac lin 1e3 1Hz 20kHz
TEXT 2160 1192 Left 2 ;C=0.5uF düşük-geçiş,\n0.5mF bant-geçiş.
TEXT 2096 1488 Left 2 ;C=25.5mF yüksek-geçiş,\n25.5uF bant-geçiş.
TEXT 1832 936 Left 2 !;tran 0 300mS 10mS
TEXT 1824 1232 Left 2 !;tran 0 300mS 10mS
TEXT 1632 1776 Left 2 ;Vçık
TEXT 1080 1656 Left 2 !;ac lin 1e3 1Hz 4kHz
TEXT 2504 1616 Left 2 ;Vçık1\nBessel düşük-geçiş
TEXT 1960 1600 Left 2 !;ac lin 1e3 1Hz 2kHz
TEXT 2536 1792 Left 2 ;Vçık2\nButterwort düşük-geçiş
TEXT 1440 1576 Left 2 ;774.97Hz\n697.22Hz
TEXT 1248 2208 Left 2 ;Vçık
TEXT 1072 2160 Left 2 !;ac lin 1e3 1Hz 2kHz
TEXT 1064 2128 Left 2 !;tran 0 100mS 0
TEXT 1040 2448 Left 2 ;PULSE(0 10V 0S 1nS 1nS 10mS 20mS)\nSINE(0 10V 1kHz)
TEXT 1608 2192 Left 2 !;ac lin 1e3 1Hz 6kHz
TEXT 2448 2232 Left 2 ;Vçık
TEXT 1616 2152 Left 2 !.tran 0 300mS 10mS

The netlist it stands for:
* 03Altspice.asc
V1 N007 0 SINE(0 10mV 5kHz) AC 1V
C1 N008 N007 10µF
R1 N008 0 35Ω
V2 N003 0 SINE(0 10mV 20Hz) AC 1V
C2 0 N004 10µF
R2 N004 N003 187Ω
V3 N005 0 SINE(0 10mV 5kHz) AC 1V
R3 N006 N005 187Ω
L1 N006 0 65.45mH
V4 N001 0 SINE(0 10mV 20Hz) AC 1V
R4 N002 0 35Ω
L2 N001 N002 65.45mH
V5 N012 0 SINE(0 10mV 40Hz) AC 1V
R5 N013 N012 250Ω
L3 N013 0 500mH
C3 0 N013 31.6µF
V6 N010 0 SINE(0 10mV 500Hz) AC 1V
R6 N011 N010 200Ω
L4 N011 0 599µH
C4 0 N011 169µF
B1 N015 N016 V=rand(time*1e5+0.2131e9)
B2 N014 N015 V=rand(time*1e5+0.0911e9)
B3 Vgrlt N014 V=rand(time*1e5)
V7 N016 0 -1.5V AC 1V
R9 N009 Vgrlt 200Ω
L6 N009 0 599µH
C6 0 N009 169µF
V8 N017 0 SINE(0 10mV 5kHz) AC 1V
R7 N018 N017 100Ω
L5 N018 N022 500mH
C5 0 N022 31.6µF
V9 N019 0 SINE(0 10mV 5kHz) AC 1V
C7 0 N020 53.1µF
R8 N020 N019 100Ω
R10 N021 N020 100Ω
C8 N019 N023 26.5µF
C9 N023 N021 26.5µF
R11 0 N023 100Ω
L7 N029 N030 2.1mH
C10 0 N030 60µF
L8 N030 N031 700µH
R12 0 N031 5.6Ω
L10 0 N032 1.5mH
C11 N029 N032 21µF
C12 N032 N033 63µF
L9 N033 N034 240µH
C13 0 N034 3.3µF
L11 N034 N035 80µH
R13 0 N035 8Ω
L12 0 N041 150µH
C14 N029 N041 2.4µF
C15 N041 N042 7.1µF
R14 0 N042 5.6Ω
V10 N029 0 SINE(0 10mV 5kHz) AC 1V
L13 Vgrlt N024 12.4mH
L14 N024 N025 14.4mH
L15 N025 N026 12mH
L16 N026 N027 8.3mH
L17 N027 N028 3.7mH
C16 0 N024 5.9µF
C17 0 N025 5.4µF
C18 0 N026 4.1µF
C19 0 N027 2.4µF
C20 0 N028 0.5µF
R15 0 N028 50Ω
V11 Vgrlt 0 -1.5V AC 1V Rser=1Ω
L18 N036 0 2.2mH
L19 N037 0 2.4mH
L20 N038 0 3.1mH
L21 N039 0 5.2mH
L22 N040 0 25.5mH
C21 Vgrlt N036 1µF
C22 N036 N037 880.6nF
C23 N037 N038 1.1µF
C24 N038 N039 1.5µF
C25 N039 N040 3.4µF
R16 0 N040 50Ω
V12 Vgrlt 0 -1.5V AC 1V Rser=1Ω
L23 N049 N050 12.2mH
C26 N049 N050 1.1µF
L24 N050 N051 15.8mH
C27 N050 N051 982.5nF
L25 N051 N052 11.5mH
C28 N051 N052 1.3µF
L26 N052 N053 5.3mH
C29 N052 N053 2.9µF
L27 N060 N050 2.3mH
L28 N061 N051 2.8mH
L29 N062 N052 4.5mH
L30 N063 N053 21.8mH
C30 0 N060 6.7µF
C31 0 N061 5.6µF
C32 0 N062 3.4µF
C33 0 N063 711.6nF
R17 0 N053 50Ω
V13 N049 0 SINE(0 10mV 5kHz) AC 1V
L31 N043 N044 22.7mH
L32 N044 N045 12.6mH
L33 N045 N046 9.6mH
L34 N046 N047 6.6mH
L35 N047 N048 2.9mH
C34 0 N044 6.1µF
C35 0 N045 4.4µF
C36 0 N046 3.3µF
C37 0 N048 0.4µF
C38 0 N047 1.9µF
R18 0 N048 50Ω
V14 N043 N054 SINE(0 10mV 5kHz) AC 2V
L36 N054 N055 12.4mH
L37 N055 N056 14.4mH
L38 N056 N057 12mH
L39 N057 N058 8.3mH
L40 N058 N059 3.7mH
C39 0 N055 5.9µF
C40 0 N056 5.4µF
C41 0 N057 4.1µF
C42 0 N058 2.4µF
C43 0 N059 0.5µF
R19 0 N059 50Ω
V15 N064 0 PULSE(0 10V 0S 1nS 1nS 10mS 20mS) AC 1V
R20 N065 N064 100Ω
L41 N065 0 2mH
C44 0 N065 12.6µF
L42 Vgrlt N066 569.42µH
L43 N066 N067 569.42µH
L44 N067 N068 569.42µH
L45 N068 N069 569.42µH
L46 N069 N070 569.42µH
L47 N070 N071 569.42µH
L48 N071 N072 569.42µH
L49 N072 N073 569.42µH
C45 0 N066 5.6942µF
C46 0 N067 5.6942µF
C47 0 N068 5.6942µF
C48 0 N069 5.6942µF
C49 0 N070 5.6942µF
C50 0 N071 5.6942µF
C51 0 N072 5.6942µF
R21 0 N073 1kΩ
V16 Vgrlt 0 -1.5V AC 1V Rser=1Ω
* 03Altspice.asc: Devreler->PasifFilitreler'in tüm verili devrelerinin LTspice uygulamaları.
* 03A • RC Yüksek-Geçiş Filitresi. Çeli "Z=Zc+Zr=1/(2*pi*f*10uFj) +35Ω" f=20Hz-->5kHz frekans arttıkça Zc-->0Ω kısadevreye
*     yaklaşıp Z=R=35Ω kalarak devre akımının dolayısıyla 1V sinüs sinyalin Vçık gücünü artırır. Düşük frekanslarda ise Vçık daha
*     zayıftır. Yüksek frekans geçiş filitresinin başlangıç kesinti fk1=Vgir/sqrt(2)=0.7071 değeri olup dB karşılığı=20*log10(0.7071)=
*     -3dB seviyedeki frekanstır, yani fk1=454.7Hz, fk2=ooHz. Azami I=1V/35Ω=28.57mA, fk1=454.7Hz için Zc=35Ω, Ik1=
*     28.57mA*0.7071=20.2mA hesaplanır ve ".ac lin 1e3 20Hz 5kHz" Bode-Linear grafikte okur. Sağdaki V1 devrede Vçık, direnç
*     üzerinden alınır.
*  • RC Düşük-Geçiş Filitresi. Sağdaki V2 devrede Vçık sığaç üzerinden alınır. Zc=1/(2*pi*f*10uFj) sığaç çelide f=1Hz için Zc=
*     15916<-90Ω, I=1V/(187Ω+Zc)=62.83<89uA enaz, Vçık=1V ençok. Kesinti Vçık=0.7071V için fk2=85.11Hz, Zc=187<-90Ω,
*     I=3.78<45mA okur.
*  • RL Yüksek-Geçiş Filitresi. Sağdaki V3 devrede Vçık bobin üzerinden alınır. fk1=454.7Hz için Zl=187<90Ω, fk2=ooHz için
*     Zl=00<90Ω, Bant genişliği bg=fk2-fk1=00Hz-454.7Hz=00Hz.
*  • RL Düşük-Geçiş Filitresi. Sağdaki V4 devrede Vçık direnç üzerinden alınır. fk2=85.11Hz için Zl=35<90Ω, fk1=1Hz için Zl=
*     6.3<90Ω, Bant genişliği bg=fk2-fk1=85.11Hz-1Hz=84.11Hz.
*  • Bant-Geçiş Filitresi. Sağdaki V5 devrede Vçık paralel LC üzerinden alınır. Azami Vçık=1V için Zc=Zl (açıkdevre) 1/2pifC=
*     2pifL ve frez=1/(2*pi*sqrt(L*C))=40Hz bulunur. Kesintiler Vçık=0.7071V için fk1=31.18Hz, fk2=51.26Hz, bg=fk2-fk1=
*     20.08Hz bulunur. frez=40Hz için Z=R+Zl//Zc=63288<89.8Ω, enazI=1V/Z=15.8<-89.8uA (uygulama 26.5<270uA okur).
*     Azami akım f=1Hz veya ooHz için Vçık=0V, I=1V/250Ω=4mA okur.
*  • Gürültülü Bant-Geçiş Filitresi. Sağdaki V6 devrede Vçık paralel LC üzerinden alınır. Rezonans fr=1/(2*pi*sqrt(599uH*169uF))=
*     500Hz bulunur. Vçık=0.7071V için fk1=498Hz, fk2=502.5Hz, bg=502.5-498=4.5Hz.
*     -Sağdaki V7 devrede gerilim kaynağı olarak karma Beyaz-Gauss gürültü üreteç bağlanıp ".tran 0 1S 0" zaman simülasyonunda
*     500Hz çınlanım frekanslı ve azami -+20mV genlikli sinüs gürültülü ses sinyali üretimi görülmektedir.
*  • Çentik Filitresi. Sağdaki V8 devrede Vçık seri LC üzerinden alınır. Rezonans fr=1/(2*pi*sqrt(L*C)=40Hz frekansta kısadevreye
*     yaklaşır, Z=100+2*pi*40*0.5j+1/(2*pi*40*31.6e-6j)=Zr=100Ω, I40=1V/100Ω=10mA, Vçık=I40*(2*pi*40*0.5j+
*     1/(2*pi*40*31.6e-6j))=2.5mV okur. Bant-yasak filitrede 0.7071V yasak/çentik bg=fk2-fk1=59Hz-27.17Hz=31.83Hz olup
*     kullanılan bg1=27.17Hz-1Hz=26.17Hz, bg2=ooHz-59Hz'dir.
*  • İkiz-T Çentik Filitresi. Sağdaki V9 devrede Vçık ikiz-T son ortadan alınır. Bode-Linear grafik ölçümleri frez=52.48Hz, Vrez=
*     103.78mV, yasak bg=fk2-fk1=211.4Hz-12.75Hz=198.65Hz, serbest bg1=12.75Hz-1Hz=11.75Hz, bg2=ooHz-211.4Hz okur.
*     Ayrıca Vgir=10mV sinüs 5kHz sinyalle Tevenin eşdeğeri Vth=10mV, seri Rth=9.95mV/4.15mA=2.4Ω okur.
*  • Tüm-geçiş Filitresi. Sağdaki V10 devrede Vçık1 düşük-geçiş (bg=fk2-fk1=634-1=633Hz), Vçık2 bant-geçiş (bg=8664-650=
*     8014Hz, frez=4219Hz, Vrez=1.12V), Vçık3 yüksek-geçiş (bg=ooHz-8345Hz) filitresidir.
*  • 10 kutuplu Butterwort Düşük-Geçiş Filitresi. Sağdaki V11 devrede Vçık=0.7071V bg=  kesinti fk2-1Hz=1kHz-1Hz=999Hz,
*     Düşük frekansta seri bobin kısadevre, paralel sığaç açıkdevreye yakın olduğundan Igir=Iyük=1V/50Ω=20mA okur.
*    -Aynı devrede son C=0.5uF-->0.5mF değiştirilirse, yüksek kazançlı çok dar Bant-Geçiş filitresi elde edilir (frez=479Hz, Vçık=
*     9.5V, bg=480-478=2Hz).
*  • 10 kutuplu Butterwort Yüksek-Geçiş Filitresi. Sağdaki V12 devrede kesinti Vçık=0.7071V için bg=fk2-fk1=ooHz-2kHz,
*     geniş pürüssüz bg, çok dar  fk1 eğimi. Yüksek frekansta seri sığaçlar kısadevre, paralelbobinler açıkdevreye yakın oldu-
*     ğundan Igir=Iyük=1V/50Ω=20mA okur.
*    -Aynı devrede son C=25.5mF-->25.5uF değiştirilirse, yüksek kazançlı çok dar Bant-Geçiş filitresi elde edilir (frez=4.15kHz,
*     Vçık=2.36V, bg=4157-4137=20Hz).
*  • 10 kutuplu Gürültülü Butterwort Düşük-Geçiş Filitresi. Sağdaki V11 devrede Vgrlt kaynaklı ".tran 0 300mS 10mS" zaman
*     simülasyonunda -+250mV genlikli, ortalama 1kHz frekanslı orta-bas gürültü ses sinyalli Vçık okunur.
*  • 10 kutuplu Gürültülü Butterwort Yüksek-Geçiş Filitresi. Sağdaki V12 devrede Vgrlt kaynaklı ".tran 0 300mS 10mS" zaman
*     simülasyonunda -+2V genlikli, ortalama 20kHz frekanslı yüksek-tiz gürültü ses sinyalli Vçık okunur.
*  • Butterwort Bant-YasakFilitresi. Sağdaki 8 kutuplu V13 devrede Vçık=0.7071V için bant-yasak bg=fk2-fk1=2561Hz-
*     675.6Hz=1885.4Hz arası olup düşük-geçiş 1Hz-675.6Hz ile yüksek-geçiş 2561Hz-ooHz kullanımdadır.
*  • Bessel kıyas Butterwort Düşük-Geçiş Filitresi. Sağdaki 10'ar kutuplu V14 devrede Vçık=0.7071V için üst Bessel fk2=
*     774.97Hz, alt Butterwort fk2=697.22Hz okur. Bessel biraz daha iyi görünmekte.
*  • Halkalı Bant-Geçiş Filitresi. Sağdaki V15 devrede Vçık paralel LC üzerinden alınır. Çınlanım frez=1/(2*pi*sqrt(2mH*
*     12.64uF))=1kHz okur. Vçık=0.7071 kesintiler için bg=fk2-fk1=1066-940=126Hz okunur. Bu devre "SINE(0 10V 1kHz)"
*     kipinde ilk10mS'de LC rezonans şarjlı açıkdevre oluşturup Vçık=10V sin 1kHz ve Içık=10V/100Ω=100mA-->0A söner.
*     Fakat devre "PULSE(0 10V 0S 1nS 1nS 10mS 20mS)" karedalga 50Hz kipinde ".tran 0 100mS 0" simülasyonda halka-
*     tekrar-sönümlü10mS tekrarlı Vçık=1V-->0V sinüs tekrarlı, Ton şarjda 100mA sönümlü, deşarjda 10mA sönümlü çalışır.
*  • Taraklı Filitre. Sağdaki V16 devrede .ac simülasyon Vçık için taraklı 5 rezonans frez/Vkazanç: 583.5Hz/94V, 1.73kHz/
*     73V, 2.79kHz/82V, 3.74kHz/88V, 5.11kHz/36V, 5.47kHz/6.8V gösterir. ".tran 0 300mS 10mS" zaman simülasyonu
*     Vgrlt beslemeyle azami -+4.5V genlikli karma frekanslı gürültü sinüs ses sinyalini neşreder.
;ac lin 1e3 20Hz 5kHz
* Vçık
* Vçık
;ac lin 1e3 1Hz 1kHz
* Vçık
;ac lin 1e3 1Hz 5kHz
* Vçık
;ac lin 1e3 1Hz 1kHz
* Vçık
;ac lin 1e3 1Hz 100Hz
* Vçık
;ac lin 1e3 450Hz 550Hz
;tran 0 1S 0
* White Gaussian Noise Generator
* Fg=500Hz (rezonans)
* Beyaz-Gauss Gürültü Üreteçi
* Vçık
* Vçık
;ac lin 1e3 1Hz 100Hz
* Vçık
;ac lin 1e3 1Hz 500Hz
;tran 0 2mS 0
;ac lin 1e3 1Hz 100kHz
* Vçık1
* Düşük-geçiş
* Vçık2
* Bant-geçiş
* Vçık3
* Yüksek-geçiş
* Vçık
;ac lin 1e3 1Hz 2kHz
* Vçık
;ac lin 1e3 1Hz 20kHz
* C=0.5uF düşük-geçiş,
* 0.5mF bant-geçiş.
* C=25.5mF yüksek-geçiş,
* 25.5uF bant-geçiş.
;tran 0 300mS 10mS
;tran 0 300mS 10mS
* Vçık
;ac lin 1e3 1Hz 4kHz
* Vçık1
* Bessel düşük-geçiş
;ac lin 1e3 1Hz 2kHz
* Vçık2
* Butterwort düşük-geçiş
* 774.97Hz
* 697.22Hz
* Vçık
;ac lin 1e3 1Hz 2kHz
;tran 0 100mS 0
* PULSE(0 10V 0S 1nS 1nS 10mS 20mS)
* SINE(0 10V 1kHz)
;ac lin 1e3 1Hz 6kHz
* Vçık
.tran 0 300mS 10mS
.backanno
.end